# Altium schematic sheet power.SchDoc
size A4; SheetNumber: 17; SheetTotal: 17
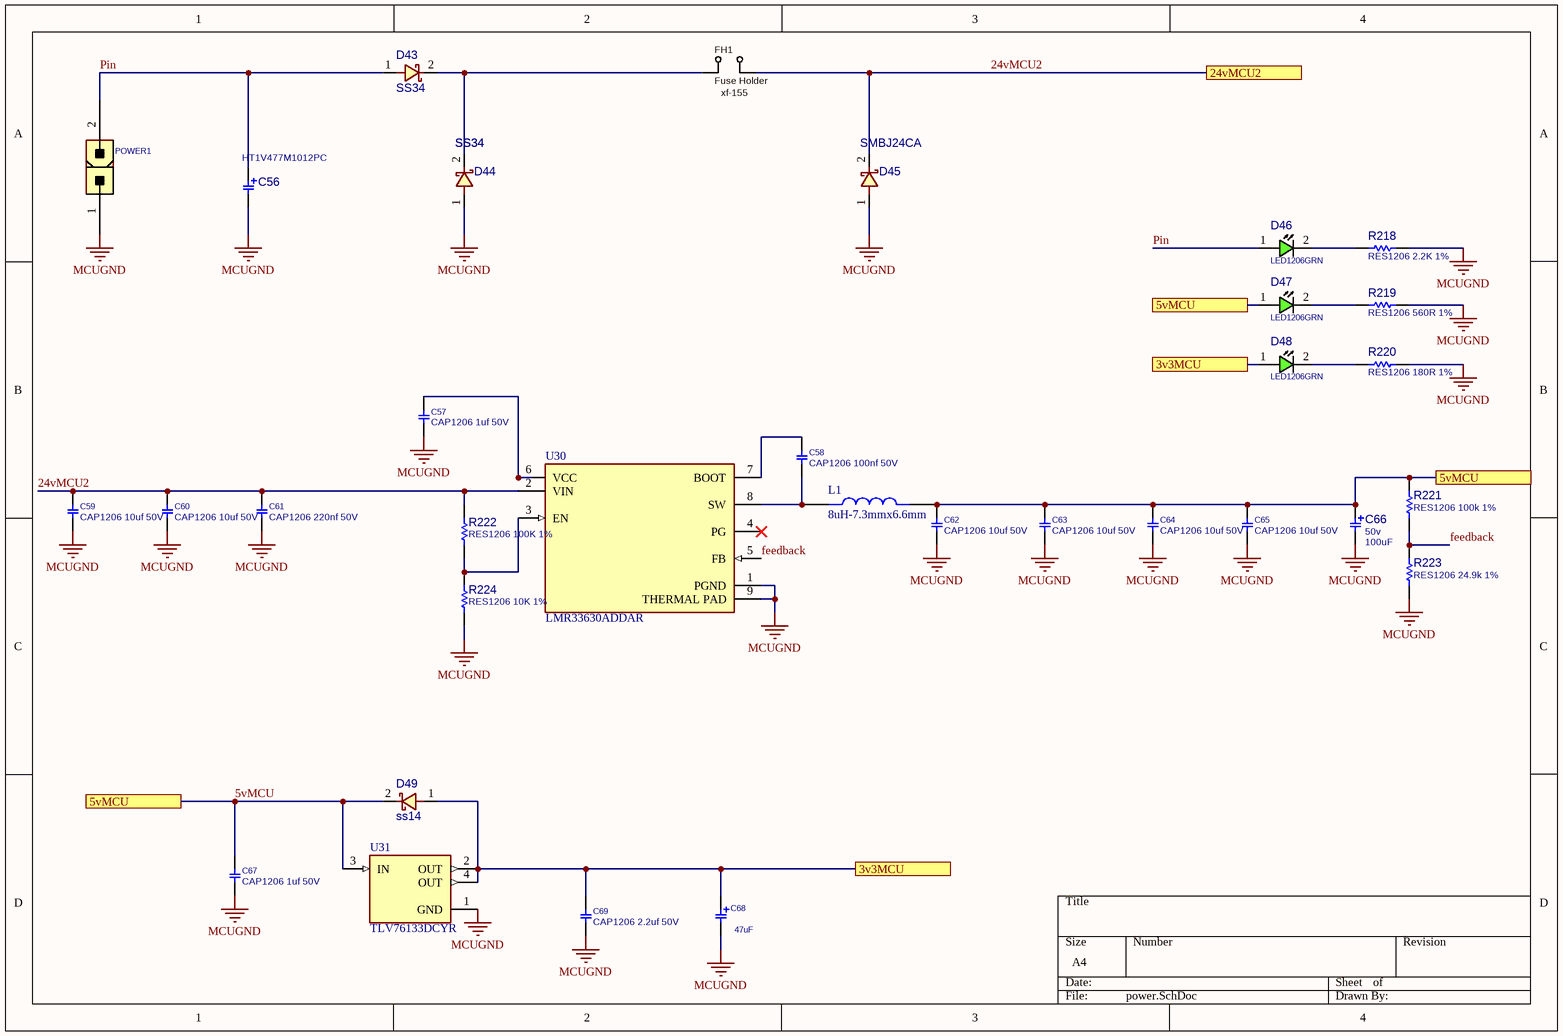
[diagram p0: power.SchDoc]

## Parts
C56  HT1V477M1012PC  [C_EL_10X16]
C57  CAP1206 1uf 50V  [C1206]
C58  CAP1206 100nf 50V  [C1206]
C59  CAP1206 10uf 50V  [C1206]
C60  CAP1206 10uf 50V  [C1206]
C61  CAP1206 220nf 50V  [C1206]
C62  CAP1206 10uf 50V  [C1206]
C63  CAP1206 10uf 50V  [C1206]
C64  CAP1206 10uf 50V  [C1206]
C65  CAP1206 10uf 50V  [C1206]
C66  PARAM2: 50v  [C_EL_8X12]  (hidden comment: 100uF)
C67  CAP1206 1uf 50V  [C1206]
C68  47uF  [C_TN_3528]
C69  CAP1206 2.2uf 50V  [C1206]
D43  SS34  [D_SMB]
D44  SS34  [D_SMB]
D45  SMBJ24CA  [D_SMB]
D46  LED1206GRN  [LED1206GRN]
D47  LED1206GRN  [LED1206GRN]
D48  LED1206GRN  [LED1206GRN]
D49  ss14  [D_SMA]
FH1  xf-155  value Fuse Holder  [FH_24101812]
L1  8uH-7.3mmx6.6mm  [IND_AMPLA7050S-100MT]
POWER1  CONN_ATXPWR_2  [ATXPWR_2]  (value not drawn)
R218  RES1206 2.2K 1%  [R1206]
R219  RES1206 560R 1%  [R1206]
R220  RES1206 180R 1%  [R1206]
R221  RES1206 100k 1%  [R1206]
R222  RES1206 100K 1%  [R1206]
R223  RES1206 24.9k 1%  [R1206]
R224  RES1206 10K 1%  [R1206]
U30  LMR33630ADDAR  [FP-DDA0008J-IPC_C]
U31  TLV76133DCYR  [VREG_TLV76133DCYR]

## Ports
3v3MCU, 5vMCU, 24vMCU2

## Nets
MCUGND: C56.2 C57.2 C59.2 C60.2 C61.2 C62.2 C63.2 C64.2 C65.2 C66.2 C67.2 C68.2 C69.2 D44.1 D45.1 POWER1.1 R218.1 R219.1 R220.1 R223.1 R224.2 U30.1(PGND) U30.9(THERMAL_PAD) U31.1(GND)
3v3MCU: C68.1 C69.1 D48.1(ANODE) D49.1 U31.2(OUT) U31.4(OUT) ; port 3v3MCU
5vMCU: C62.1 C63.1 C64.1 C65.1 C66.1 C67.1 D47.1(ANODE) D49.2 L1.2 R221.2 U31.3(IN) ; port 5vMCU
24vMCU2: C59.1 C60.1 C61.1 D45.2 FH1.2 R222.1 U30.2(VIN) ; port 24vMCU2
feedback: R221.1 R223.2 U30.5(FB)
Pin: C56.1 D43.1 D46.1(ANODE) POWER1.2
NetC57_1: C57.1 U30.6(VCC)
NetC58_1: C58.1 U30.7(BOOT)
NetC58_2: C58.2 L1.1 U30.8(SW)
NetD43_2: D43.2 D44.2 FH1.1
NetD46_2: D46.2(CATHODE) R218.2
NetD47_2: D47.2(CATHODE) R219.2
NetD48_2: D48.2(CATHODE) R220.2
NetR222_2: R222.2 R224.1 U30.3(EN)

Not connected (* = marked no-connect by the designer): U30 4(PG)*

## Library data of the parts
C56 = CAP_THD_EL_470uF_35v: CAP, THD, ELEC,; MANF_P#: MANF_PART#; DESC: DESCRIPTION; DIST#: MOUSER; PARAM: 20%; PARAM2: 35v; VALUE: 470uF; PRICE: 10= -$; MANF: MANF; ASSEMBLY: ASSEMBLY
C57-C65 C67 C69 = CAP_SMD_MLCC_1206: CAP, MLCC; PARAM: -, -%; MANF_P#: MANF_PART#; PARAM2: -V; PRICE: 100= 1$; MANF: -; ASSEMBLY: ASSEMBLY
C66 = CAP_THD_EL_100uF_50v: CAP, THD, ELEC,; MANF_P#: MANF_PART#; DESC: DESCRIPTION; DIST#: MOUSER; PARAM: 20%; PRICE: 10= -$; MANF: MANF; ASSEMBLY: ASSEMBLY; VALUE: 100uF
C68 = CAP_SMD_TAN: CAP, SMD, TAN; PARAM: 20%, 300mOhm, -55~105oC; MANF: VISHAY; MANF_P#: T55A106M6R3C0300; PARAM2: 6.3V; PRICE: 0.46$; VALUE: 47uF
D43 D44 = DIODE_SMD_SCHOTTKY_SS34: DIODE, SCHOTTKY, 20V, 3A; MANF: VISHAY; DESC: DESCRIPTION; ASSEMBLY: ASSEMBLY; PRICE: PRICE; PARAM2: 3A; PARAM: 20V; VALUE: SS34
  D44: MANF_P#: SS34
D45 = DIODE_SMD_SCHOTTKY_SS34: DIODE,TVS, 24V, 15A; MANF: VISHAY; MANF_P#: SS34; DESC: DESCRIPTION; PARAM2: 3A; PARAM: 20V; ASSEMBLY: ASSEMBLY; PRICE: PRICE; VALUE: SMBJ24CA
D46-D48 = LED_SMD_1206_GRN: LED, SMD, 1206, GREEN; PARAM: 20mA; DESC: DESCRIPTION; PARAM2: 2.2V; MANF: -; ASSEMBLY: ASSEMBLY; PRICE: 36t@Javan; MANF_P#: -; VALUE: LED1206GRN; MountType: SMT; PartType: LED
D49 = DIODE_SMD_SCHOTTKY_B345A: DIODE, SCHOTTKY, 40V, 3A; MANF: DIODES; MANF_P#: B345AE-13; DESC: DESCRIPTION; PARAM2: 45Vrrm, 0.45Vf; PARAM: 3A, -50~150oC; ASSEMBLY: ASSEMBLY; PRICE: 0.35$; VALUE: ss14
FH1 = FUSE_SMD_HOLDER_24101812: Fuse SMD2410 Holder; PARAM: max. 10A; MANF: Littelfuse; MANF_P#: 01550900M; PARAM2: 125v; PRICE: 0.2$; PACKAGE: SMD,5.0x9.7mm
L1 = AMPLA7050S-100MT: Inductor Power Shielded/Molded Wirewound 10uH 20% 100KHz Carbonyl Powder 4A 0.069Ohm DCR T/R; MF: Abracon Corporation; SnapEDA_Link: https://www.snapeda.com/parts/AMPLA7050S-100MT/Abracon/view-part/?ref=snap; Purchase-URL: https://pricing.snapeda.com/search/part/AMPLA7050S-100MT/?ref=eda; Package: Package; MP: AMPLA7050S-100MT; Price: None; Availability: In Stock; Check_prices: https://www.snapeda.com/parts/AMPLA7050S-100MT/Abracon/view-part/?ref=eda; Value: *
POWER1 = CONN_ATXPWR_2: CONN, ATX POWER, 2 P; MANF: Molex; MANF_P#: 39281023; VALUE: CONN_ATXPWR_2; MountType: THD; PACKAGE: ATXPWR-2pin; Part Type: Conn.
R218-R224 = RES_SMD_1206: RESISTOR, SMD; PARAM: 1%, 0.25W; DESC: DESCRIPTION; DIST#: MOUSER; MANF_P#: -; MANF: -; ASSEMBLY: ASSEMBLY; PRICE: -; PARAM2: -
U30 = CMP-04918-000184-1: IC REG BUCK ADJUSTABLE 3A 8SOPWR; Switching Frequency: 400kHz; Number of Outputs: 1; Output Configuration: Positive; Synchronous Rectifier: Yes; Min Output Voltage: 1V; Max Output Voltage: 24V; Max Input Voltage: 36V; Min Input Voltage: 3.8V; Output Current: 3A; Min Operating Temperature: -40°C; Max Operating Temperature: 125°C; Number of Pins: 8; RoHS Compliant: Yes; Mount: Surface Mount; Output Type: Adjustable; Packaging: Cut Tape
U31 = TLV76133DCYR: 1-A 16-V high-PSRR linear voltage regulator; MF: Texas Instruments; SnapEDA_Link: https://www.snapeda.com/parts/TLV76133DCYR/Texas+Instruments/view-part/?ref=snap; Package: SOT-223-4 Texas Instruments; Value: *; MP: TLV76133DCYR; Check_prices: https://www.snapeda.com/parts/TLV76133DCYR/Texas+Instruments/view-part/?ref=eda